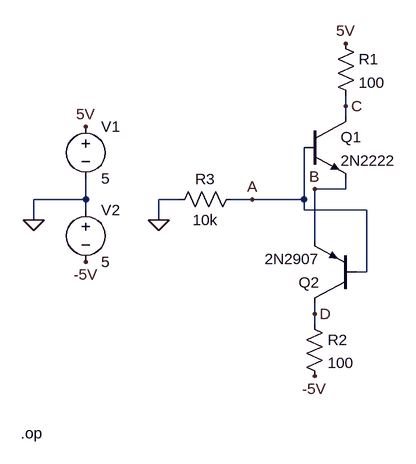
[diagram p0: schematic problem2dc.asc]
problem2dc.asc, the LTspice schematic file:
Version 4
SHEET 1 880 680
WIRE 192 32 192 16
WIRE 192 48 192 32
WIRE 192 160 192 144
WIRE 192 160 144 160
WIRE -208 176 -208 144
WIRE -208 176 -288 176
WIRE -64 176 -96 176
WIRE 48 176 16 176
WIRE 128 176 128 96
WIRE 128 176 48 176
WIRE -208 192 -208 176
WIRE 128 192 128 176
WIRE 224 192 128 192
WIRE -288 208 -288 176
WIRE -96 208 -96 176
WIRE 144 240 144 160
WIRE 224 288 224 192
WIRE 224 288 208 288
WIRE 144 352 144 336
WIRE 144 368 144 352
FLAG -288 208 0
FLAG -208 64 5V
FLAG 192 -64 5V
FLAG -208 272 -5V
FLAG 144 448 -5V
FLAG -96 208 0
FLAG 48 176 A
FLAG 192 32 C
FLAG 144 160 B
FLAG 144 352 D
SYMBOL npn 128 48 R0
SYMATTR InstName Q1
SYMATTR Value 2N2222
SYMBOL pnp 208 336 R180
SYMATTR InstName Q2
SYMATTR Value 2N2907
SYMBOL res 176 -80 R0
SYMATTR InstName R1
SYMATTR Value 100
SYMBOL res 128 352 R0
SYMATTR InstName R2
SYMATTR Value 100
SYMBOL res 32 160 R90
WINDOW 0 0 56 VBottom 2
WINDOW 3 32 56 VTop 2
SYMATTR InstName R3
SYMATTR Value 10k
SYMBOL voltage -208 48 R0
WINDOW 123 0 0 Left 0
WINDOW 39 0 0 Left 0
SYMATTR InstName V1
SYMATTR Value 5
SYMBOL voltage -208 176 R0
WINDOW 123 0 0 Left 0
WINDOW 39 0 0 Left 0
SYMATTR InstName V2
SYMATTR Value 5
TEXT -308 536 Left 2 !.op

The netlist it stands for:
* problem2dc.asc
Q1 C A B 0 2N2222
Q2 D A B 0 2N2907
R1 5V C 100
R2 D -5V 100
R3 A 0 10k
V1 5V 0 5
V2 0 -5V 5
.model NPN NPN
.model PNP PNP
.lib standard.bjt
.op
.backanno
.end